# Altium schematic sheet Eth_2_5Gbe.SchDoc
size C; SheetNumber: 4; SheetTotal: 4
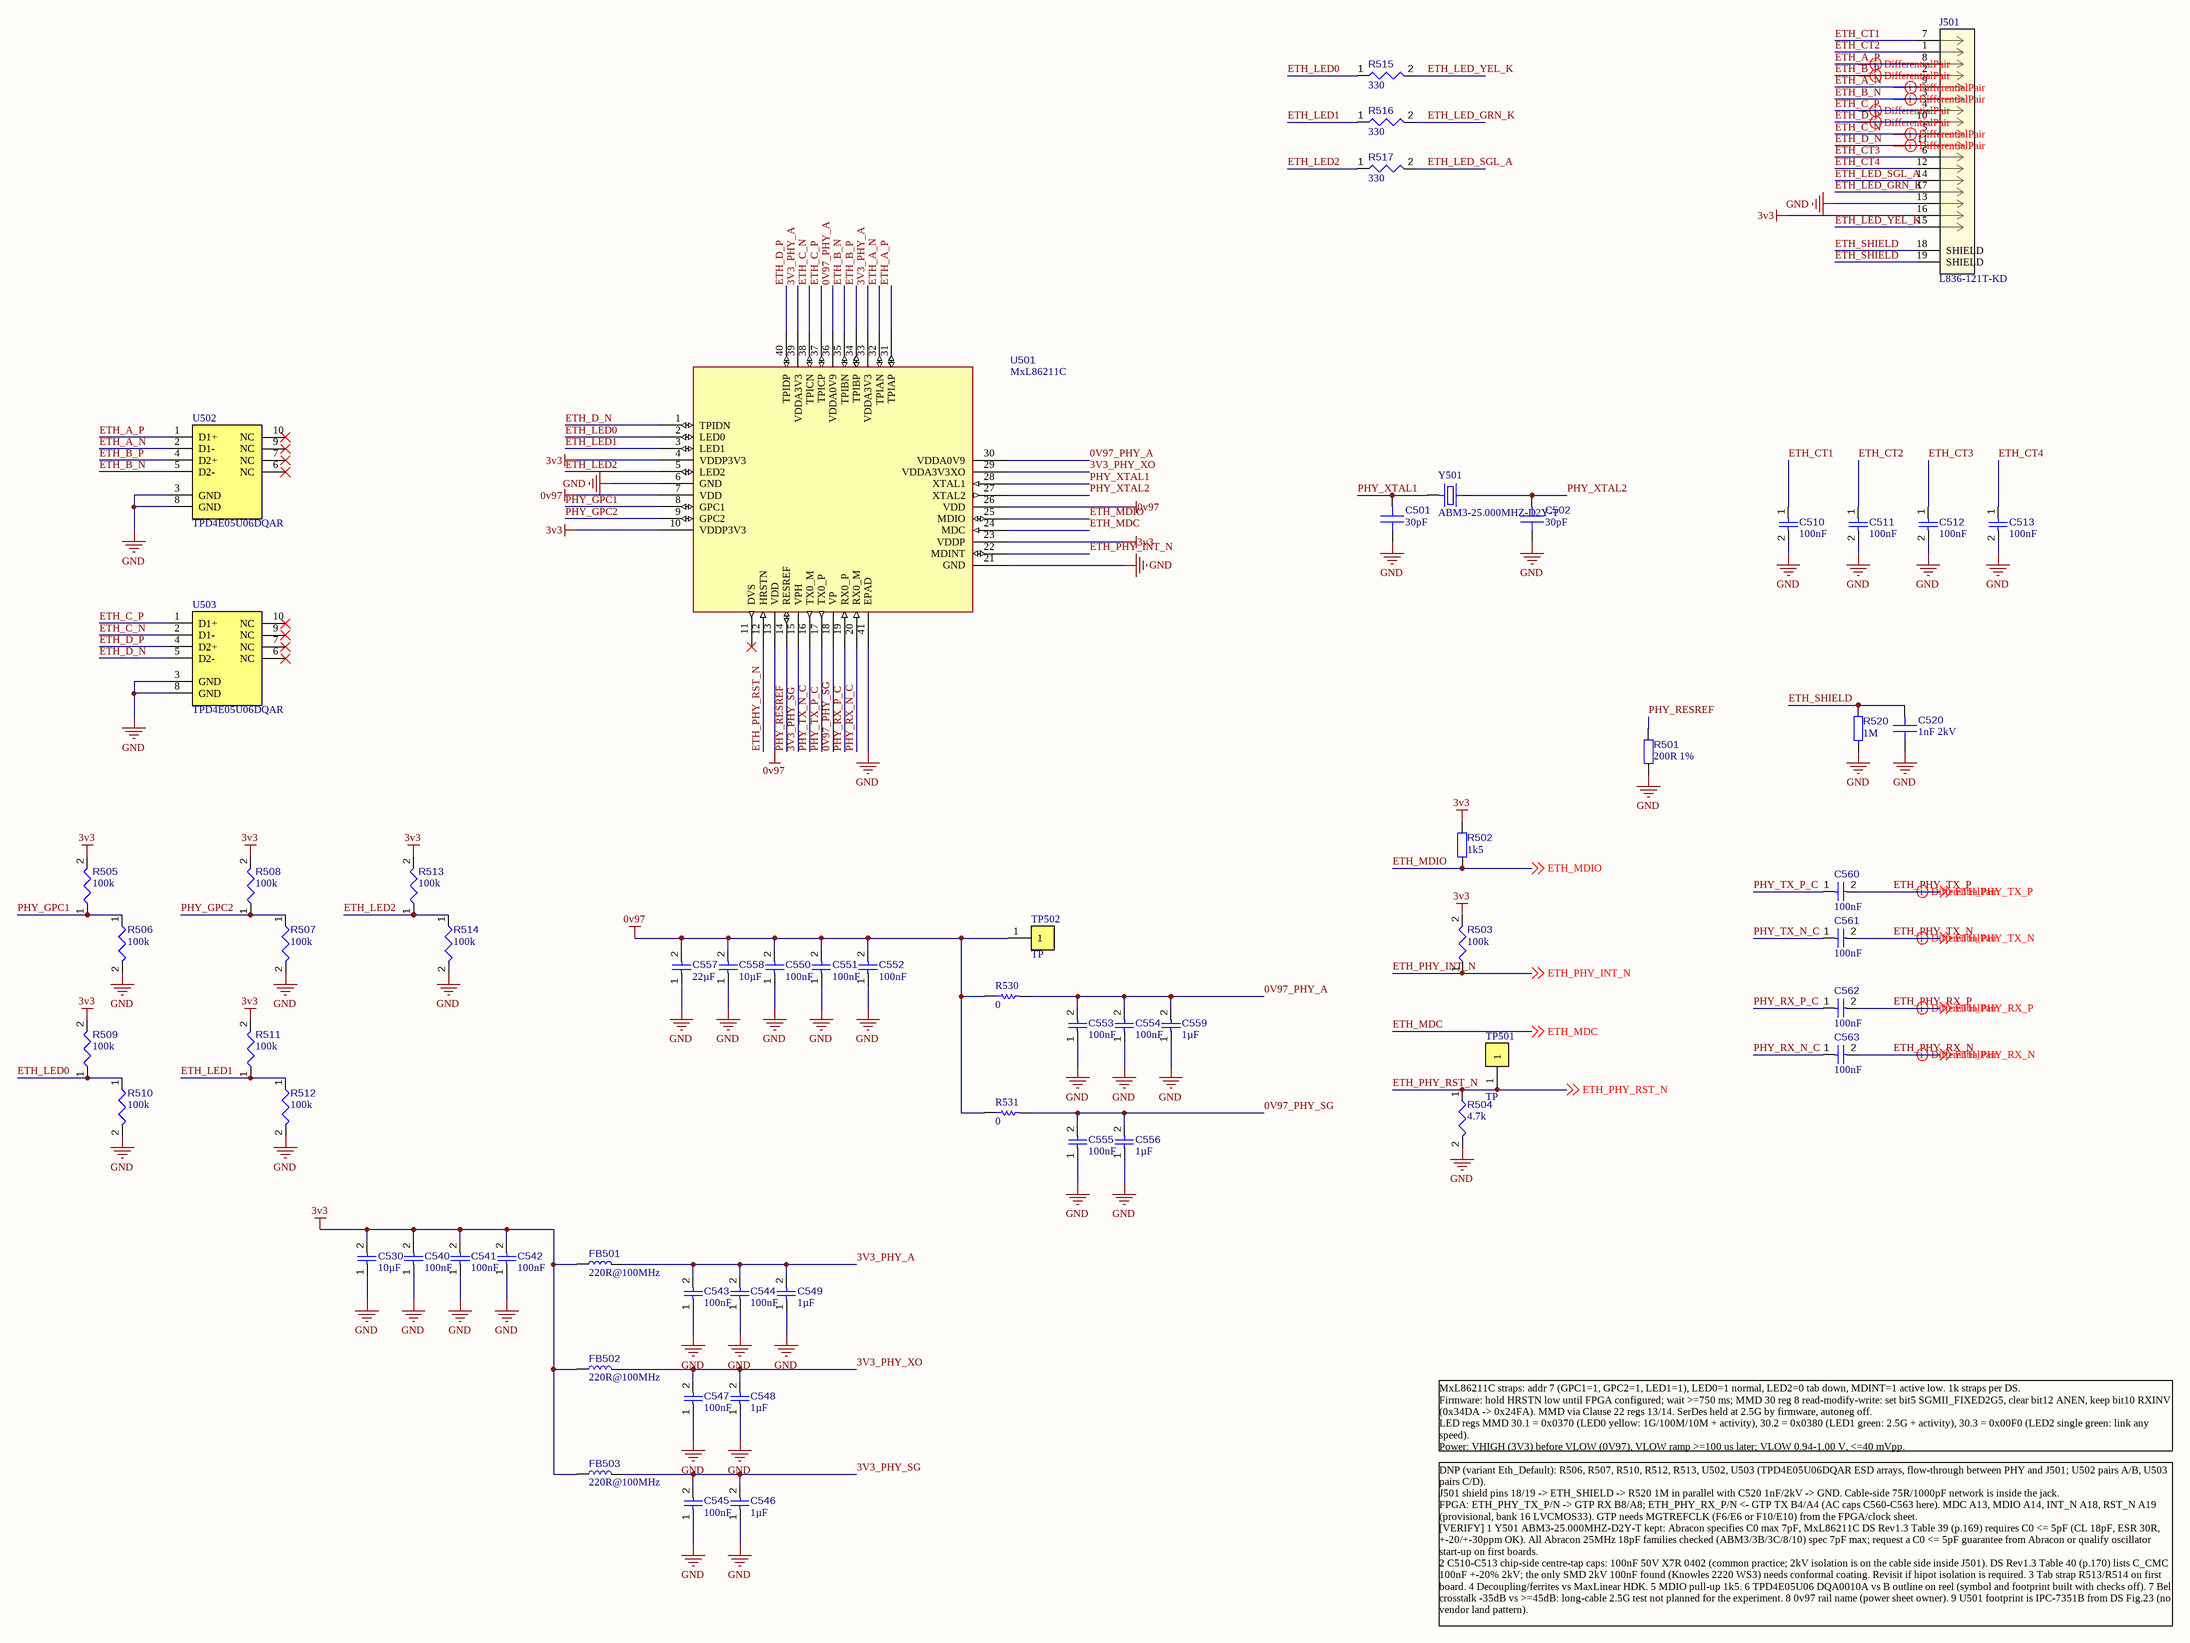
[diagram p0: Eth_2_5Gbe.SchDoc]

## Parts
C501  30pF  [CAPC1005X55N_GRM155]
C502  30pF  [CAPC1005X55N_GRM155]
C510  value 100nF  [CAPC0402(1005)60_L]  (hidden comment: Capacitor 100nF +/-20% 50V 0402)
C511  value 100nF  [CAPC0402(1005)60_L]  (hidden comment: Capacitor 100nF +/-20% 50V 0402)
C512  value 100nF  [CAPC0402(1005)60_L]  (hidden comment: Capacitor 100nF +/-20% 50V 0402)
C513  value 100nF  [CAPC0402(1005)60_L]  (hidden comment: Capacitor 100nF +/-20% 50V 0402)
C520  1nF 2kV  [CAPC3316X180N_AVX1206HV]
C530  value 10µF  [CAPC0603(1608)100_L]  (hidden comment: Capacitor 10µF +/-20% 10V 0603)
C540  value 100nF  [CAPC1005X56X25LL10T15]  (hidden comment: Capacitor 0.1 uF +/- 5% 16 V 0402)
C541  value 100nF  [CAPC1005X56X25LL10T15]  (hidden comment: Capacitor 0.1 uF +/- 5% 16 V 0402)
C542  value 100nF  [CAPC1005X56X25LL10T15]  (hidden comment: Capacitor 0.1 uF +/- 5% 16 V 0402)
C543  value 100nF  [CAPC1005X56X25LL10T15]  (hidden comment: Capacitor 0.1 uF +/- 5% 16 V 0402)
C544  value 100nF  [CAPC1005X56X25LL10T15]  (hidden comment: Capacitor 0.1 uF +/- 5% 16 V 0402)
C545  value 100nF  [CAPC1005X56X25LL10T15]  (hidden comment: Capacitor 0.1 uF +/- 5% 16 V 0402)
C546  value 1µF  [CAPC1005X55X25LL05T10]  (hidden comment: Capacitor 1 uF +/- 10% 6.3 V 0402)
C547  value 100nF  [CAPC1005X56X25LL10T15]  (hidden comment: Capacitor 0.1 uF +/- 5% 16 V 0402)
C548  value 1µF  [CAPC1005X55X25LL05T10]  (hidden comment: Capacitor 1 uF +/- 10% 6.3 V 0402)
C549  value 1µF  [CAPC1005X55X25LL05T10]  (hidden comment: Capacitor 1 uF +/- 10% 6.3 V 0402)
C550  value 100nF  [CAPC1005X56X25LL10T15]  (hidden comment: Capacitor 0.1 uF +/- 5% 16 V 0402)
C551  value 100nF  [CAPC1005X56X25LL10T15]  (hidden comment: Capacitor 0.1 uF +/- 5% 16 V 0402)
C552  value 100nF  [CAPC1005X56X25LL10T15]  (hidden comment: Capacitor 0.1 uF +/- 5% 16 V 0402)
C553  value 100nF  [CAPC1005X56X25LL10T15]  (hidden comment: Capacitor 0.1 uF +/- 5% 16 V 0402)
C554  value 100nF  [CAPC1005X56X25LL10T15]  (hidden comment: Capacitor 0.1 uF +/- 5% 16 V 0402)
C555  value 100nF  [CAPC1005X56X25LL10T15]  (hidden comment: Capacitor 0.1 uF +/- 5% 16 V 0402)
C556  value 1µF  [CAPC1005X55X25LL05T10]  (hidden comment: Capacitor 1 uF +/- 10% 6.3 V 0402)
C557  value 22µF  [CAPC0805(2012)145_L]  (hidden comment: Capacitor 22µF +/-40% 16V 0805)
C558  value 10µF  [CAPC0603(1608)100_L]  (hidden comment: Capacitor 10µF +/-20% 10V 0603)
C559  value 1µF  [CAPC1005X55X25LL05T10]  (hidden comment: Capacitor 1 uF +/- 10% 6.3 V 0402)
C560  value 100nF  [CAPC1005X56X25LL10T15]  (hidden comment: Capacitor 0.1 uF +/- 5% 16 V 0402)
C561  value 100nF  [CAPC1005X56X25LL10T15]  (hidden comment: Capacitor 0.1 uF +/- 5% 16 V 0402)
C562  value 100nF  [CAPC1005X56X25LL10T15]  (hidden comment: Capacitor 0.1 uF +/- 5% 16 V 0402)
C563  value 100nF  [CAPC1005X56X25LL10T15]  (hidden comment: Capacitor 0.1 uF +/- 5% 16 V 0402)
FB501  220R@100MHz  [MURATA_BLM18P_0603]
FB502  220R@100MHz  [MURATA_BLM18P_0603]
FB503  220R@100MHz  [MURATA_BLM18P_0603]
J501  L836-121T-KD  [CONN17_L836-121T-KD_BEL]
R501  200R 1%  [RESC1005X40N_RC0402]
R502  1k5  [RESC1005X40N_RC0402]
R503  value 100k  [RESC1005X40X25ML05T05]  (hidden comment: Resistor 1k +/-1% 0402 63 mW)
R504  value 4.7k  [RESC1005X40X25ML05T05]  (hidden comment: Resistor 4k7 +/-1% 0402 63 mW)
R505  value 100k  [RESC1005X40X25ML05T05]  (hidden comment: Resistor 1k +/-1% 0402 63 mW)
R506  value 100k  [RESC1005X40X25ML05T05]  (hidden comment: Resistor 1k +/-1% 0402 63 mW)
R507  value 100k  [RESC1005X40X25ML05T05]  (hidden comment: Resistor 1k +/-1% 0402 63 mW)
R508  value 100k  [RESC1005X40X25ML05T05]  (hidden comment: Resistor 1k +/-1% 0402 63 mW)
R509  value 100k  [RESC1005X40X25ML05T05]  (hidden comment: Resistor 1k +/-1% 0402 63 mW)
R510  value 100k  [RESC1005X40X25ML05T05]  (hidden comment: Resistor 1k +/-1% 0402 63 mW)
R511  value 100k  [RESC1005X40X25ML05T05]  (hidden comment: Resistor 1k +/-1% 0402 63 mW)
R512  value 100k  [RESC1005X40X25ML05T05]  (hidden comment: Resistor 1k +/-1% 0402 63 mW)
R513  value 100k  [RESC1005X40X25ML05T05]  (hidden comment: Resistor 1k +/-1% 0402 63 mW)
R514  value 100k  [RESC1005X40X25ML05T05]  (hidden comment: Resistor 1k +/-1% 0402 63 mW)
R515  value 330  [RESC0402(1005)_L]  (hidden comment: Resistor 330R +/-5 % 0402 63 mW)
R516  value 330  [RESC0402(1005)_L]  (hidden comment: Resistor 330R +/-5 % 0402 63 mW)
R517  value 330  [RESC0402(1005)_L]  (hidden comment: Resistor 330R +/-5 % 0402 63 mW)
R520  1M  [RESC3216X65N_RC1206]
R530  value 0  [RESC1608X55X25ML10T15]  (hidden comment: Resistor 0R +/- 5% 0603 100 mW)
R531  value 0  [RESC1608X55X25ML10T15]  (hidden comment: Resistor 0R +/- 5% 0603 100 mW)
TP501  TP  [TP_SMD_1R00]
TP502  TP  [TP_SMD_1R00]
U501  MxL86211C  [MXL_VQFN-40_5x5_P0.4_EP3.79]
U502  TPD4E05U06DQAR  [TI_USON-10_DQA0010A]
U503  TPD4E05U06DQAR  [TI_USON-10_DQA0010A]
Y501  ABM3-25.000MHZ-D2Y-T  [ABRACON_ABM3_5.0x3.2]

## Nets
0v97: C550.2 C551.2 C552.2 C557.2 C558.2 R530.1 R531.1 TP502.1 U501.7(VDD) U501.13(VDD) U501.26(VDD)
3v3: C530.2 C540.2 C541.2 C542.2 FB501.1 FB502.1 FB503.1 J501.16 R502.2 R503.2 R505.2 R508.2 R509.2 R511.2 R513.2 U501.4(VDDP3V3) U501.10(VDDP3V3) U501.23(VDDP)
GND: C501.2 C502.2 C510.2 C511.2 C512.2 C513.2 C520.2 C530.1 C540.1 C541.1 C542.1 C543.1 C544.1 C545.1 C546.1 C547.1 C548.1 C549.1 C550.1 C551.1 C552.1 C553.1 C554.1 C555.1 C556.1 C557.1 C558.1 C559.1 J501.13 R501.2 R504.2 R506.2 R507.2 R510.2 R512.2 R514.2 R520.2 U501.6(GND) U501.21(GND) U501.41(EPAD) U502.3(GND) U502.8(GND) U503.3(GND) U503.8(GND)
0V97_PHY_A: C553.2 C554.2 C559.2 R530.2 U501.30(VDDA0V9) U501.36(VDDA0V9)
0V97_PHY_SG: C555.2 C556.2 R531.2 U501.18(VP)
3V3_PHY_A: C543.2 C544.2 C549.2 FB501.2 U501.33(VDDA3V3) U501.39(VDDA3V3)
3V3_PHY_SG: C545.2 C546.2 FB503.2 U501.15(VPH)
3V3_PHY_XO: C547.2 C548.2 FB502.2 U501.29(VDDA3V3XO)
ETH_A_N: J501.9 U501.32(TPIAN) U502.2(D1-)
ETH_A_P: J501.8 U501.31(TPIAP) U502.1(D1+)
ETH_B_N: J501.3 U501.35(TPIBN) U502.5(D2-)
ETH_B_P: J501.2 U501.34(TPIBP) U502.4(D2+)
ETH_C_N: J501.5 U501.38(TPICN) U503.2(D1-)
ETH_C_P: J501.4 U501.37(TPICP) U503.1(D1+)
ETH_CT1: C510.1 J501.7
ETH_CT2: C511.1 J501.1
ETH_CT3: C512.1 J501.6
ETH_CT4: C513.1 J501.12
ETH_D_N: J501.11 U501.1(TPIDN) U503.5(D2-)
ETH_D_P: J501.10 U501.40(TPIDP) U503.4(D2+)
ETH_LED0: R509.1 R510.1 R515.1 U501.2(LED0)
ETH_LED1: R511.1 R512.1 R516.1 U501.3(LED1)
ETH_LED2: R513.1 R514.1 R517.1 U501.5(LED2)
ETH_LED_GRN_K: J501.17 R516.2
ETH_LED_SGL_A: J501.14 R517.2
ETH_LED_YEL_K: J501.15 R515.2
ETH_MDC: U501.24(MDC) ; off-sheet ETH_MDC
ETH_MDIO: R502.1 U501.25(MDIO) ; off-sheet ETH_MDIO
ETH_PHY_INT_N: R503.1 U501.22(MDINT) ; off-sheet ETH_PHY_INT_N
ETH_PHY_RST_N: R504.1 TP501.1 U501.12(HRSTN) ; off-sheet ETH_PHY_RST_N
ETH_PHY_RX_N: C563.2 ; off-sheet ETH_PHY_RX_N
ETH_PHY_RX_P: C562.2 ; off-sheet ETH_PHY_RX_P
ETH_PHY_TX_N: C561.2 ; off-sheet ETH_PHY_TX_N
ETH_PHY_TX_P: C560.2 ; off-sheet ETH_PHY_TX_P
ETH_SHIELD: C520.1 J501.18(SHIELD) J501.19(SHIELD) R520.1
PHY_GPC1: R505.1 R506.1 U501.8(GPC1)
PHY_GPC2: R507.1 R508.1 U501.9(GPC2)
PHY_RESREF: R501.1 U501.14(RESREF)
PHY_RX_N_C: C563.1 U501.20(RX0_M)
PHY_RX_P_C: C562.1 U501.19(RX0_P)
PHY_TX_N_C: C561.1 U501.16(TX0_M)
PHY_TX_P_C: C560.1 U501.17(TX0_P)
PHY_XTAL1: C501.1 U501.28(XTAL1) Y501.1
PHY_XTAL2: C502.1 U501.27(XTAL2) Y501.2

Not connected (* = marked no-connect by the designer): U501 11(DVS)*; U502 6(NC)* 7(NC)* 9(NC)* 10(NC)*; U503 6(NC)* 7(NC)* 9(NC)* 10(NC)*

## Layout directives
differential pair: ETH_A_N, ETH_A_P, ETH_B_N, ETH_B_P, ETH_C_N, ETH_C_P, ETH_D_N, ETH_D_P, ETH_PHY_RX_N, ETH_PHY_RX_P, ETH_PHY_TX_N, ETH_PHY_TX_P

## Notes on the sheet
- MxL86211C straps: addr 7 (GPC1=1, GPC2=1, LED1=1), LED0=1 normal, LED2=0 tab down, MDINT=1 active low. 1k straps per DS.
  Firmware: hold HRSTN low until FPGA configured; wait >=750 ms; MMD 30 reg 8 read-modify-write: set bit5 SGMII_FIXED2G5, clear bit12 ANEN, keep bit10 RXINV (0x34DA -> 0x24FA). MMD via Clause 22 regs 13/14. SerDes held at 2.5G by firmware, autoneg off.
  LED regs MMD 30.1 = 0x0370 (LED0 yellow: 1G/100M/10M + activity), 30.2 = 0x0380 (LED1 green: 2.5G + activity), 30.3 = 0x00F0 (LED2 single green: link any speed).
  Power: VHIGH (3V3) before VLOW (0V97), VLOW ramp >=100 us later; VLOW 0.94-1.00 V, <=40 mVpp.
- DNP (variant Eth_Default): R506, R507, R510, R512, R513, U502, U503 (TPD4E05U06DQAR ESD arrays, flow-through between PHY and J501; U502 pairs A/B, U503 pairs C/D).
  J501 shield pins 18/19 -> ETH_SHIELD -> R520 1M in parallel with C520 1nF/2kV -> GND. Cable-side 75R/1000pF network is inside the jack.
  FPGA: ETH_PHY_TX_P/N -> GTP RX B8/A8; ETH_PHY_RX_P/N <- GTP TX B4/A4 (AC caps C560-C563 here). MDC A13, MDIO A14, INT_N A18, RST_N A19 (provisional, bank 16 LVCMOS33). GTP needs MGTREFCLK (F6/E6 or F10/E10) from the FPGA/clock sheet.
  [VERIFY] 1 Y501 ABM3-25.000MHZ-D2Y-T kept: Abracon specifies C0 max 7pF, MxL86211C DS Rev1.3 Table 39 (p.169) requires C0 <= 5pF (CL 18pF, ESR 30R, +-20/+-30ppm OK). All Abracon 25MHz 18pF families checked (ABM3/3B/3C/8/10) spec 7pF max; request a C0 <= 5pF guarantee from Abracon or qualify oscillator start-up on first boards.
  2 C510-C513 chip-side centre-tap caps: 100nF 50V X7R 0402 (common practice; 2kV isolation is on the cable side inside J501). DS Rev1.3 Table 40 (p.170) lists C_CMC 100nF +-20% 2kV; the only SMD 2kV 100nF found (Knowles 2220 WS3) needs conformal coating. Revisit if hipot isolation is required. 3 Tab strap R513/R514 on first board. 4 Decoupling/ferrites vs MaxLinear HDK. 5 MDIO pull-up 1k5. 6 TPD4E05U06 DQA0010A vs B outline on reel (symbol and footprint built with checks off). 7 Bel crosstalk -35dB vs >=45dB: long-cable 2.5G test not planned for the experiment. 8 0v97 rail name (power sheet owner). 9 U501 footprint is IPC-7351B from DS Fig.23 (no vendor land pattern).

## Library data of the parts
C501 C502 = CAP_0402: 30pF C0G 50V 0402; Manufacturer: Murata; Manufacturer Part Number: GRM1555C1H300JA01D
C510-C513 = CMP-001-00067-3: Chip Capacitor, 100nF +/-20%, 50V, 0402, Thickness 0.6 mm; Tolerance: 10%; Min Operating Temperature: -55°C; Pins: 2; Case/Package: 0402; Max Operating Temperature: 85°C; Voltage Rating: 50V; Mounting Technology: SMT
C520 = CAP_1206HV: 1nF 2kV X7R 1206; Manufacturer: KYOCERA AVX; Manufacturer Part Number: 1206GC102KAT2A; VERIFY: AVX HV note: may need surface coating to prevent external arcing
C530 C558 = CMP-001-00075-4: Chip Capacitor, 10µF +/-20%, 10V, 0603, Thickness 1 mm; Tolerance: 10%; Voltage Rating: 10V; Max Operating Temperature: 85°C; Pins: 2; Case/Package: 0603; Mounting Technology: SMT; Min Operating Temperature: -55°C
C540-C545 C547 C550-C555 C560-C563 = CMP-001-00001-6: Chip Capacitor, 0.1 uF, +/- 5%, 16 V, 0402 (1005 Metric); Capacitor Type: Ceramic; Voltage Rating: 16V; Max Operating Temperature: 125°C; Min Operating Temperature: -55°C; Case/Package: 0402; Mounting Technology: SM; Pins: 2; Tolerance: 5%; RoHS Compliant: True
C546 C548 C549 C556 C559 = CMP-001-00008-6: Chip Capacitor, 1 uF, +/- 10%, 6.3 V, 0402 (1005 Metric); Capacitor Type: Ceramic; Voltage Rating: 6.3V; Max Operating Temperature: 85°C; Mounting Technology: SM; Tolerance: 10%; Case/Package: 0402; RoHS Compliant: True; Min Operating Temperature: -55°C; Pins: 2
C557 = CMP-001-00081-4: Chip Capacitor, 22µF +/-40%, 16V, 0805, Thickness 1.45 mm; Tolerance: 5%; Voltage Rating: 16V; Mounting Technology: SMT; Pins: 2; Max Operating Temperature: 85°C; Case/Package: 0805; Min Operating Temperature: -55°C
FB501-FB503 = FERRITE: Ferrite 220R@100MHz 0603, 1.4A @85C, 0.14R max; Manufacturer: Murata; Manufacturer Part Number: BLM18PG221SN1D
J501 = L836-121T-KD: No Description Available; Manufacturer_Name: Belfuse; Manufacturer: Bel; Copyright: Copyright (C) 2026 Ultra Librarian. All rights reserved.; Manufacturer_Part_Number: L836-121T-KD; RefDes: RefDes; Type: Type; Manufacturer Part Number: L836-121T-KD
R501 = RES_0402: 200R 1% 0402; Manufacturer: Yageo; Manufacturer Part Number: RC0402FR-07200RL
R502 = RES_0402: 1k5 1% 0402; Manufacturer: Yageo; Manufacturer Part Number: RC0402FR-071K5L; VERIFY: MDIO pull-up value, DS gives none
R503 R505-R514 = CMP-009-00012-5: Chip Resistor, 1 KOhm, +/- 1%, 63 mW, -55 to 155 degC, 0402 (1005 Metric); Power: 63mW; Max Operating Temperature: 155°C; Min Operating Temperature: -55°C; Case/Package: 0402; Pins: 2; RoHS Compliant: True; Tolerance: 1%; Mounting Technology: SM
R504 = CMP-009-00034-5: Chip Resistor, 4.7 KOhm, +/- 1%, 63 mW, -55 to 155 degC, 0402 (1005 Metric); Power: 63mW; Voltage Rating: 50V; Case/Package: 0402; Tolerance: 1%; Max Operating Temperature: 155°C; Pins: 2; RoHS Compliant: True; Min Operating Temperature: -55°C; Mounting Technology: SM
R515-R517 = CMP-009-00132-3: Chip Resistor, 330 Ohms, +/-5 %, 63 mW, -55 to 155 degC, 0402; Power: 63mW; Tolerance: 5%; Pins: 2; Max Operating Temperature: 155°C; Min Operating Temperature: -55°C; Case/Package: 0402
R520 = RES_1206: 1M 1% 1206; Manufacturer: Yageo; Manufacturer Part Number: RC1206FR-071ML
R530 R531 = CMP-009-00006-5: Chip Resistor, 0 Ohm, 0.1 W, -55 to 155 degC, 0603 (1608 Metric); Power: 100mW; Voltage Rating: 50V; Max Operating Temperature: 155°C; RoHS Compliant: True; Mounting Technology: SM; Case/Package: 0603; Min Operating Temperature: -55°C; Tolerance: 5%; Pins: 2
TP501 = TESTPOINT: Test point HRSTN
TP502 = TESTPOINT: Test point 0V97
U501 = MxL86211C: 2.5GBASE-T PHY, PG-VQFN-40 5x5; Manufacturer: MaxLinear; Manufacturer Part Number: MXL86211C-AQB-T
U502 = TPD4E05U06DQAR: 4-ch ESD, 0.42-0.5pF typ, USON-10, DNP. Pairs A/B; Manufacturer: Texas Instruments; VERIFY: DQA0010A vs B outline on reel, place flow-through between PHY and J501; Manufacturer Part Number: TPD4E05U06DQAR
U503 = TPD4E05U06DQAR: 4-ch ESD, 0.42-0.5pF typ, USON-10, DNP. Pairs C/D; Manufacturer: Texas Instruments; VERIFY: DQA0010A vs B outline on reel, place flow-through between PHY and J501; Manufacturer Part Number: TPD4E05U06DQAR
Y501 = XTAL2P: Crystal, 2 pad; Manufacturer: Abracon; VERIFY: FAILS DS Table 39: C0 max 7pF (ABM3 rev 04-25-22 p.1) vs <=5pF required. CL 18pF, ESR 30R, +-20/+-30ppm OK; Manufacturer Part Number: ABM3-25.000MHZ-D2Y-T